# Altium schematic sheet PCB-MAIN_02_MCU.SchDoc
size 594 x 420 mm
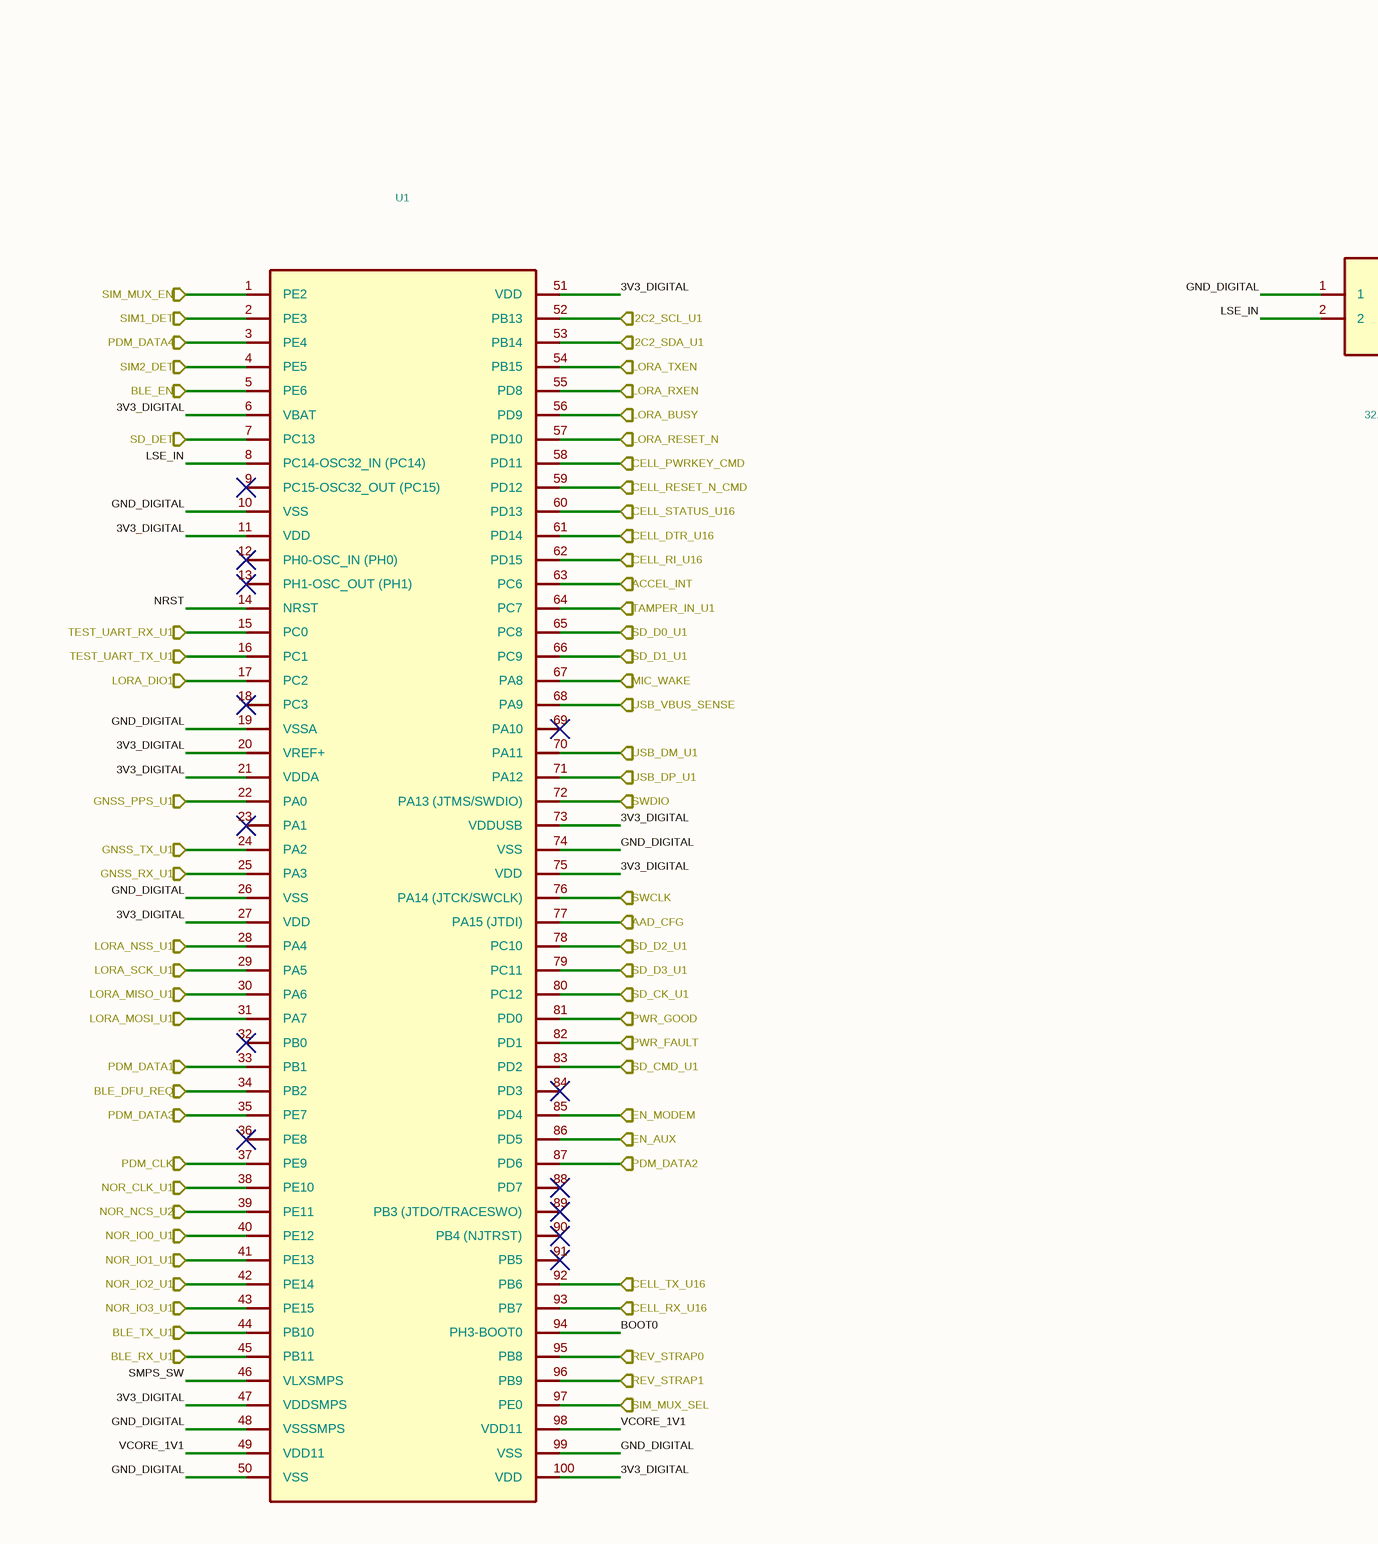
[diagram p0: PCB-MAIN_02_MCU.SchDoc, top left]
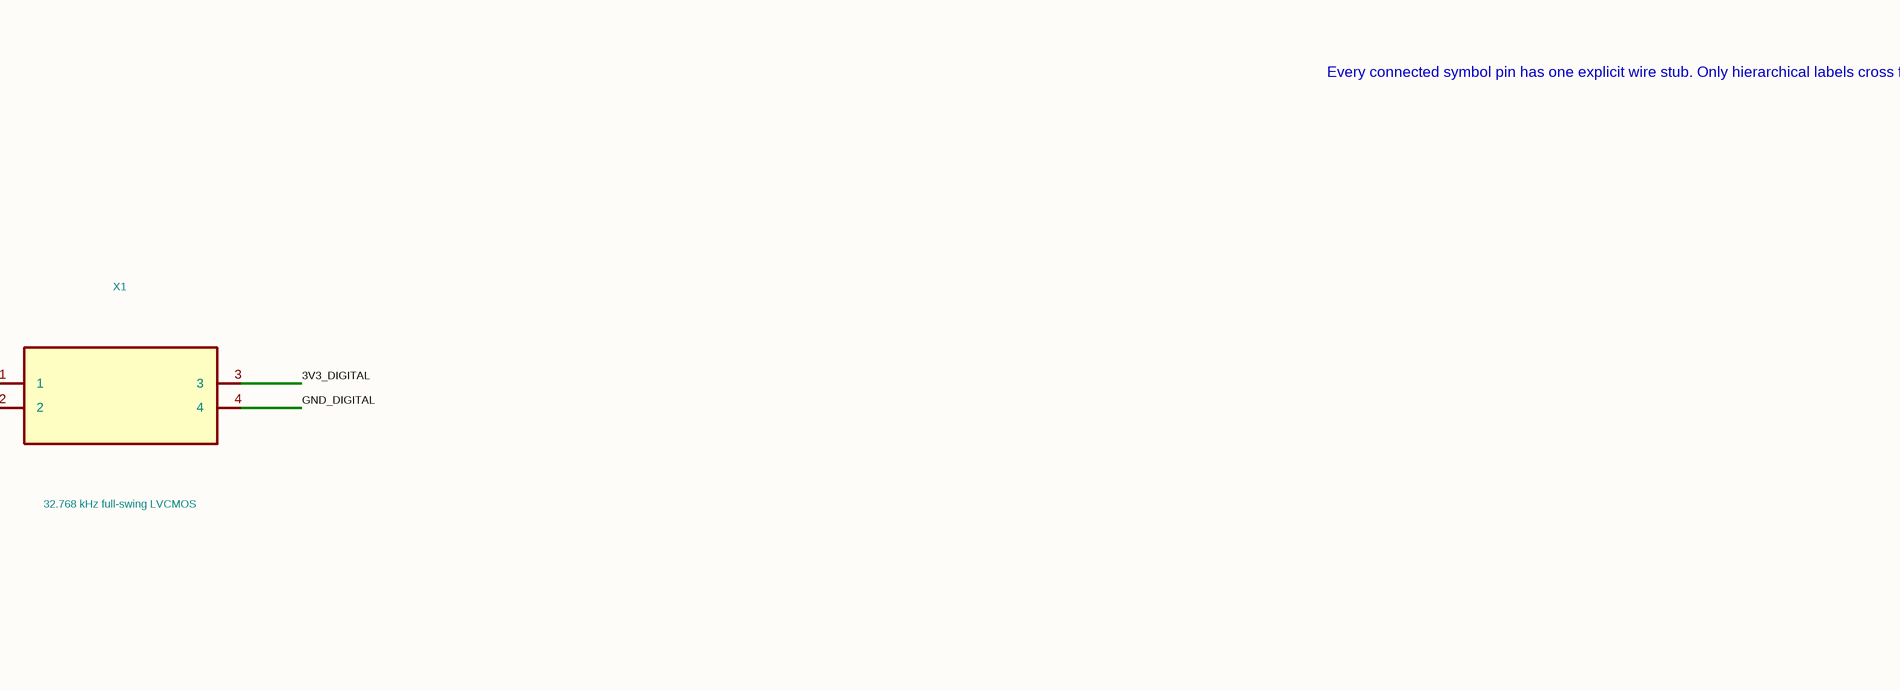
[diagram p1: PCB-MAIN_02_MCU.SchDoc, top middle]
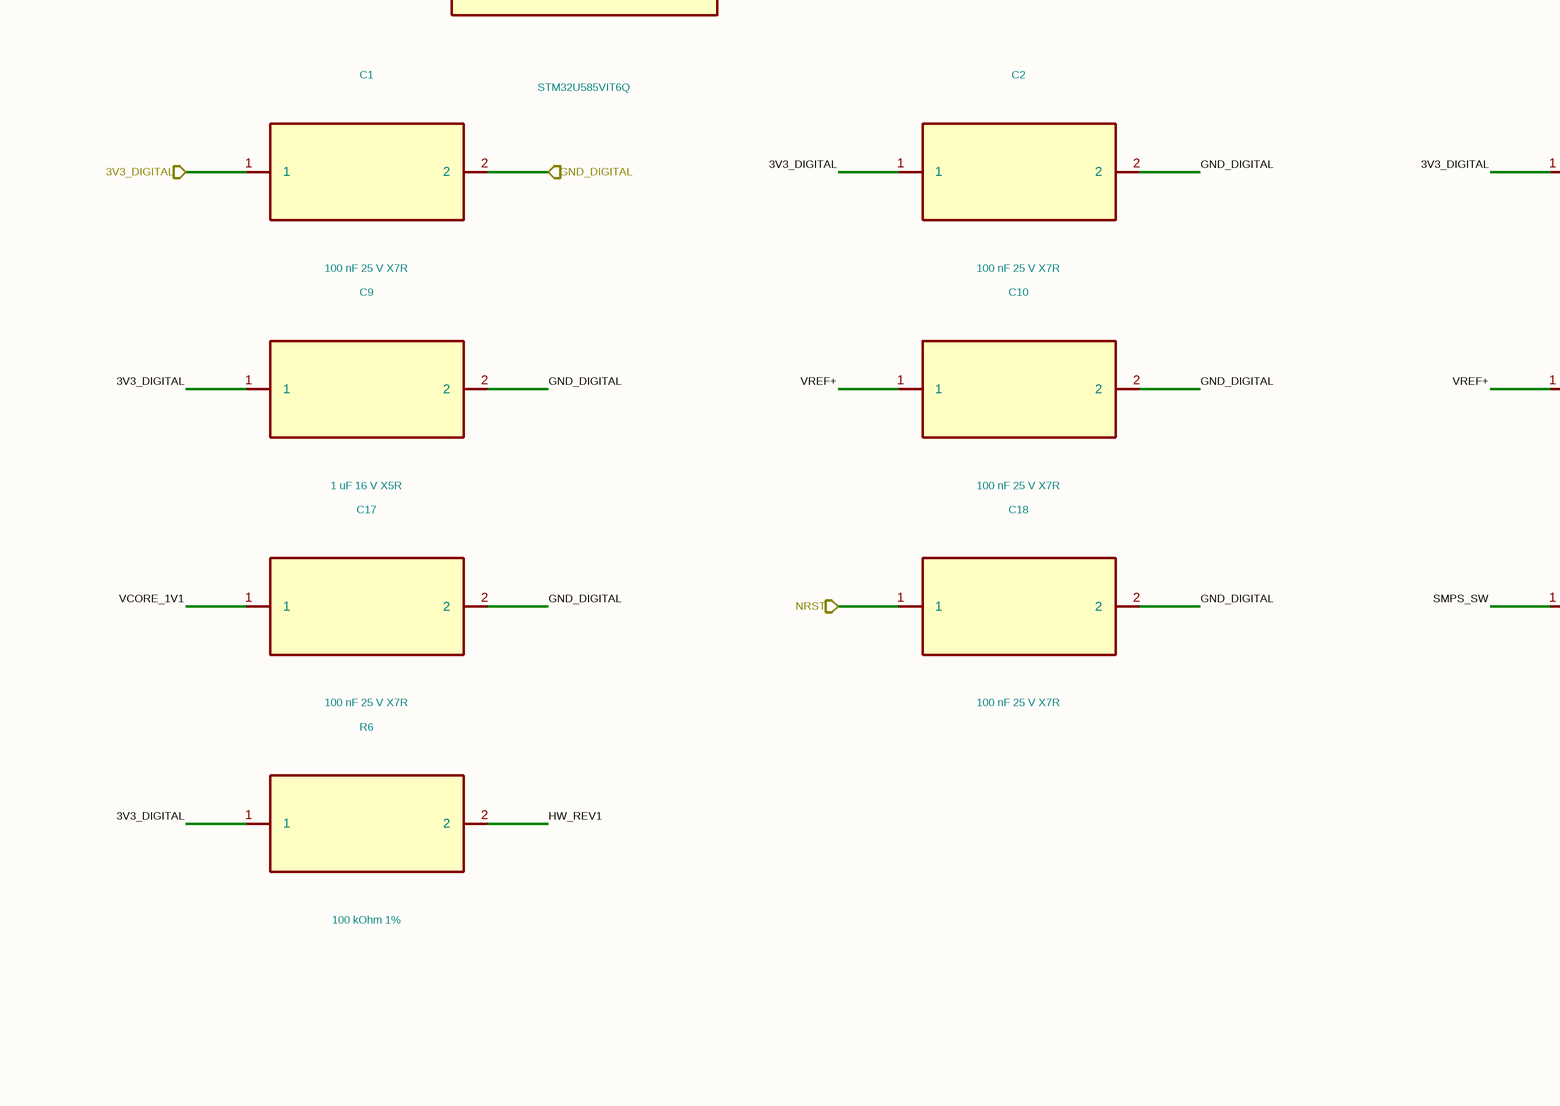
[diagram p2: PCB-MAIN_02_MCU.SchDoc, centre left]
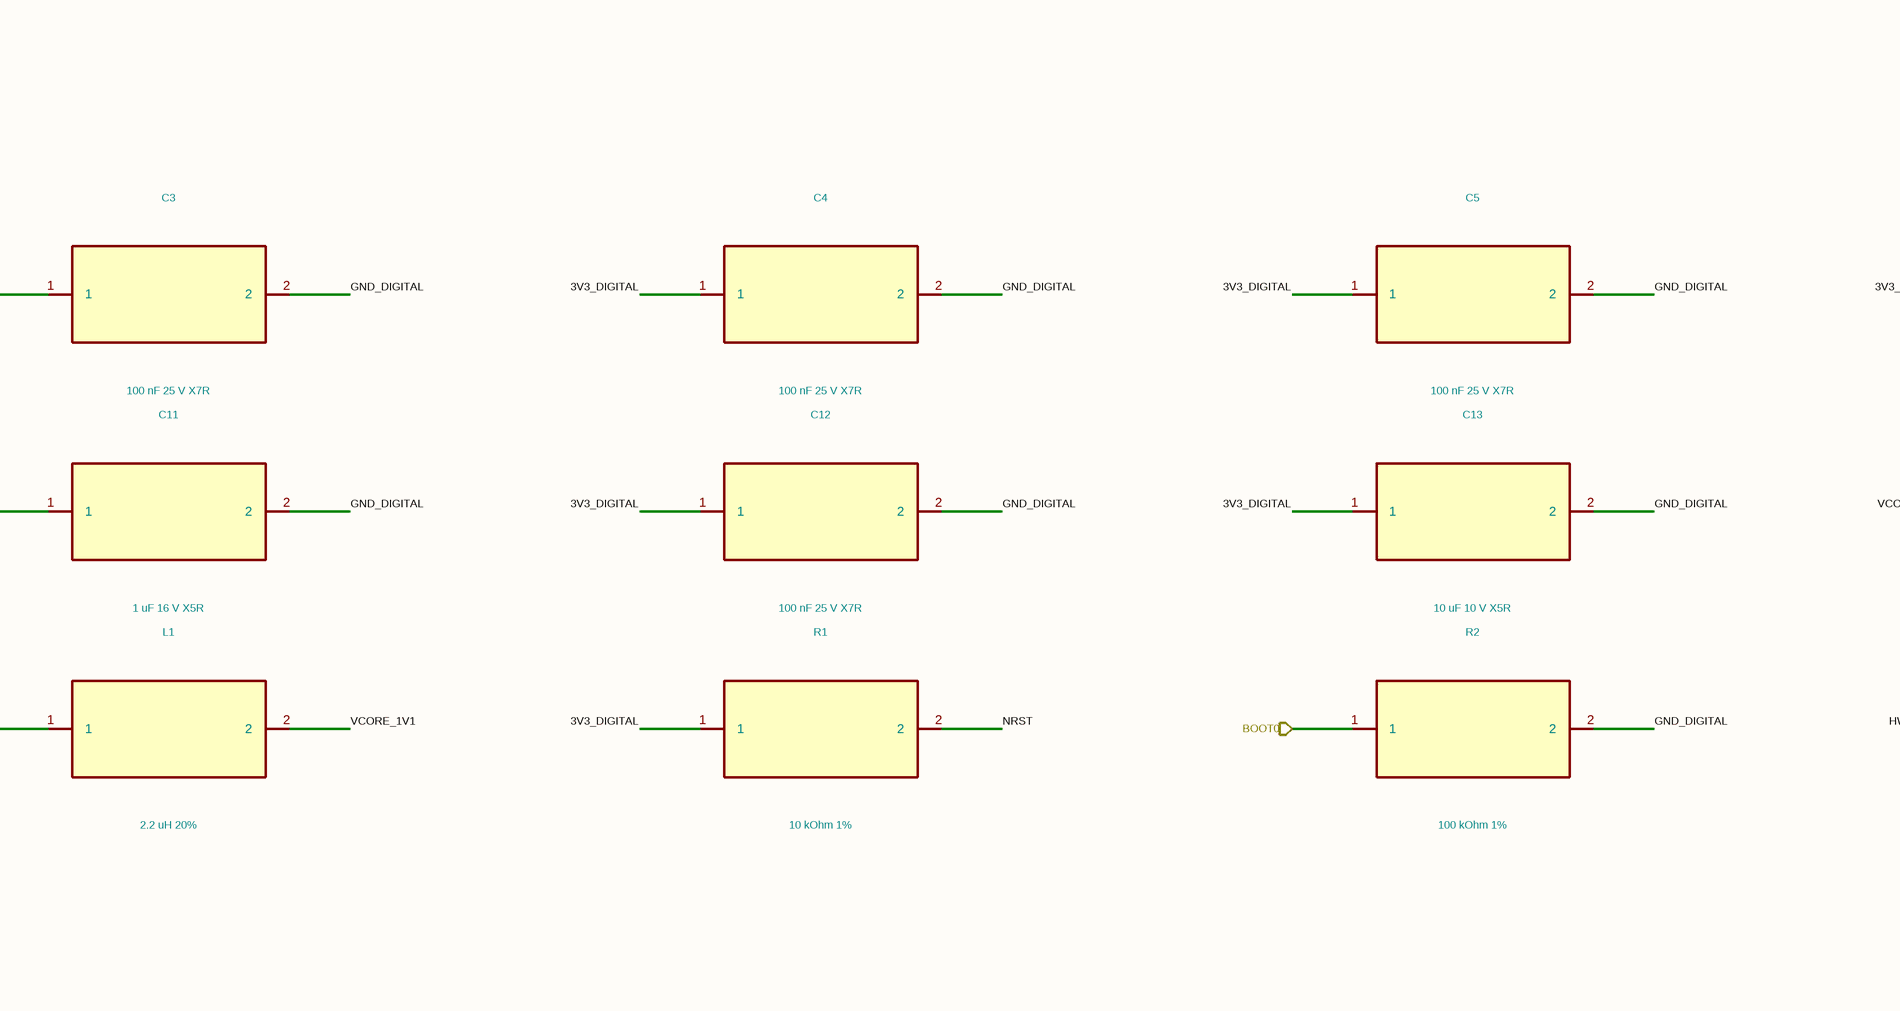
[diagram p3: PCB-MAIN_02_MCU.SchDoc, centre middle]
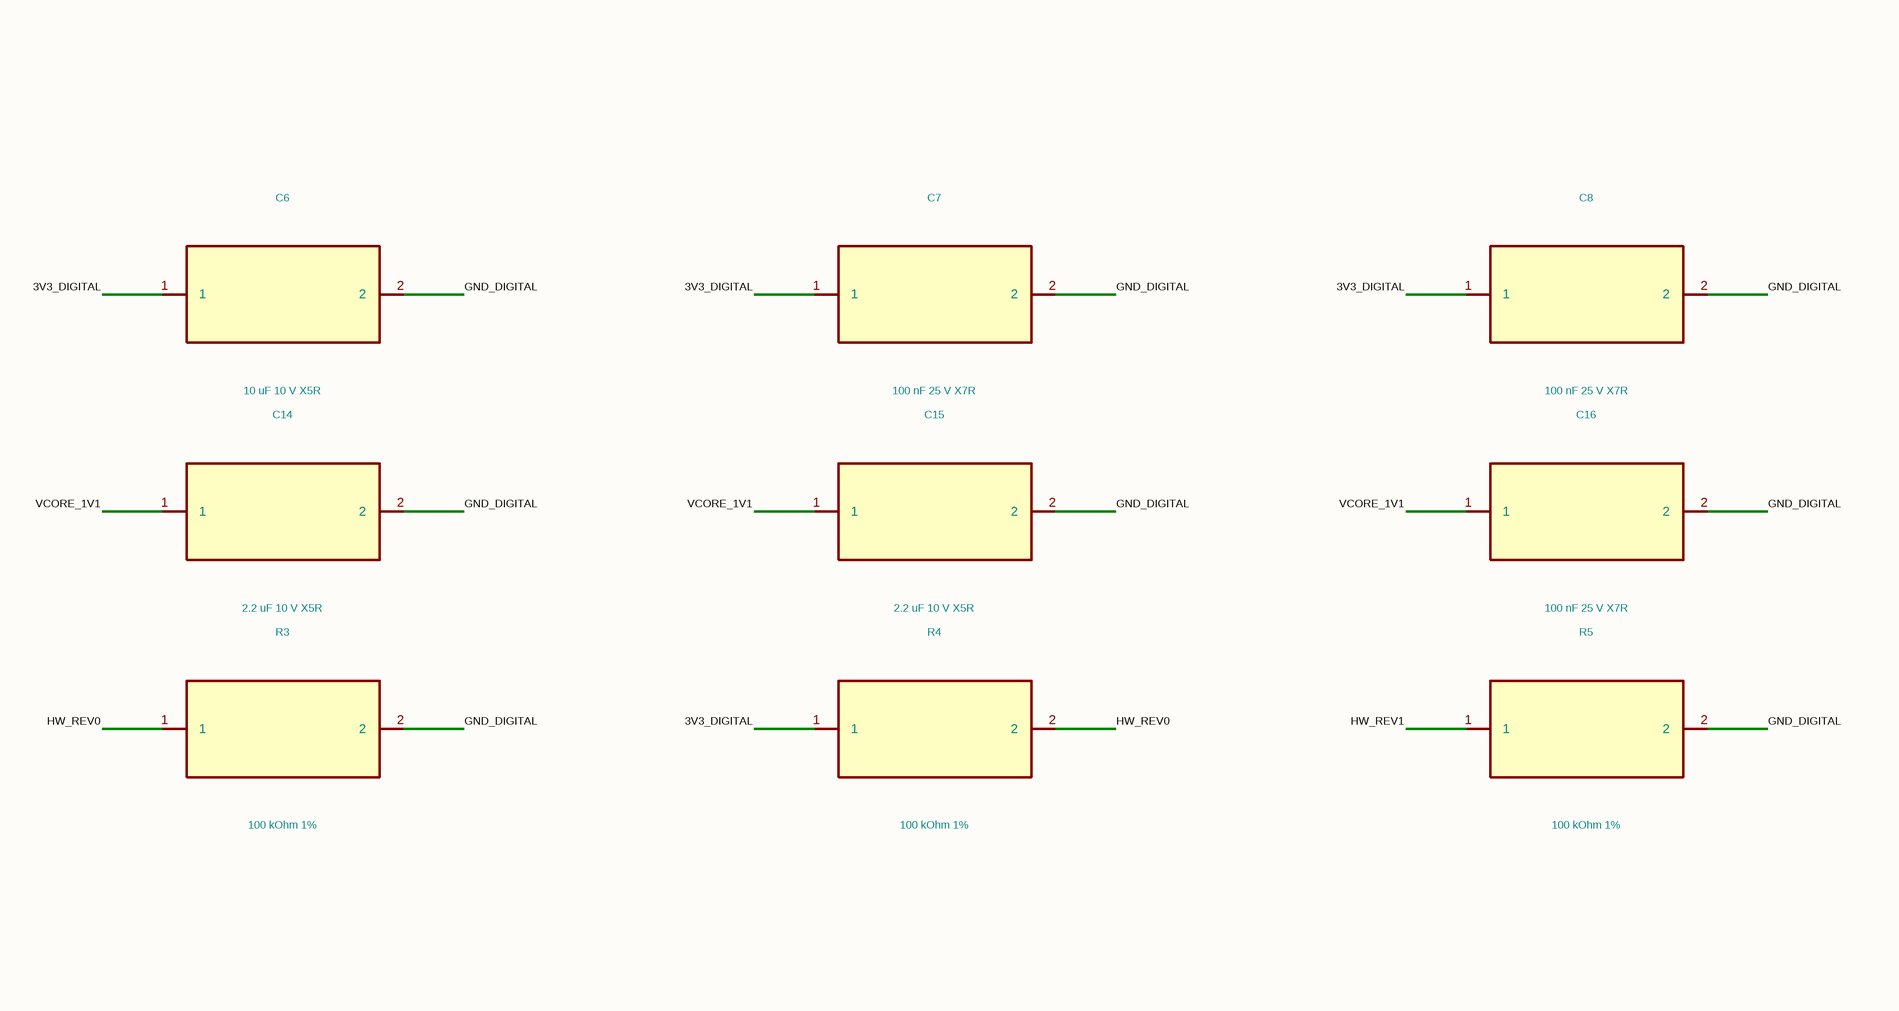
[diagram p4: PCB-MAIN_02_MCU.SchDoc, centre right]
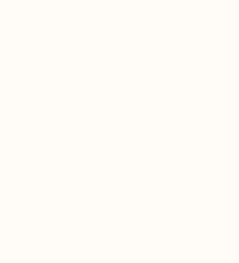
[diagram p5: PCB-MAIN_02_MCU.SchDoc, bottom left]

## Parts
C1  100 nF 25 V X7R  [C_0402_1005Metric]
C2  100 nF 25 V X7R  [C_0402_1005Metric]
C3  100 nF 25 V X7R  [C_0402_1005Metric]
C4  100 nF 25 V X7R  [C_0402_1005Metric]
C5  100 nF 25 V X7R  [C_0402_1005Metric]
C6  10 uF 10 V X5R  [C_0603_1608Metric]
C7  100 nF 25 V X7R  [C_0402_1005Metric]
C8  100 nF 25 V X7R  [C_0402_1005Metric]
C9  1 uF 16 V X5R  [C_0402_1005Metric]
C10  100 nF 25 V X7R  [C_0402_1005Metric]
C11  1 uF 16 V X5R  [C_0402_1005Metric]
C12  100 nF 25 V X7R  [C_0402_1005Metric]
C13  10 uF 10 V X5R  [C_0603_1608Metric]
C14  2.2 uF 10 V X5R  [C_0402_1005Metric]
C15  2.2 uF 10 V X5R  [C_0402_1005Metric]
C16  100 nF 25 V X7R  [C_0402_1005Metric]
C17  100 nF 25 V X7R  [C_0402_1005Metric]
C18  100 nF 25 V X7R  [C_0402_1005Metric]
L1  2.2 uH 20%  [L_1210_3225Metric]
R1  10 kOhm 1%  [R_0402_1005Metric]
R2  100 kOhm 1%  [R_0402_1005Metric]
R3  100 kOhm 1%  [R_0402_1005Metric]
R4  100 kOhm 1%  [R_0402_1005Metric]
R5  100 kOhm 1%  [R_0402_1005Metric]
R6  100 kOhm 1%  [R_0402_1005Metric]
U1  STM32U585VIT6Q
X1  32.768 kHz full-swing LVCMOS

## Ports
3V3_DIGITAL, AAD_CFG, ACCEL_INT, BLE_DFU_REQ, BLE_EN, BLE_RX_U1, BLE_TX_U1, BOOT0, CELL_DTR_U16, CELL_PWRKEY_CMD, CELL_RESET_N_CMD, CELL_RI_U16, CELL_RX_U16, CELL_STATUS_U16, CELL_TX_U16, EN_AUX, EN_MODEM, GND_DIGITAL, GNSS_PPS_U1, GNSS_RX_U1, GNSS_TX_U1, I2C2_SCL_U1, I2C2_SDA_U1, LORA_BUSY, LORA_DIO1, LORA_MISO_U1, LORA_MOSI_U1, LORA_NSS_U1, LORA_RESET_N, LORA_RXEN, LORA_SCK_U1, LORA_TXEN, MIC_WAKE, NOR_CLK_U1, NOR_IO0_U1, NOR_IO1_U1, NOR_IO2_U1, NOR_IO3_U1, NOR_NCS_U2, NRST, PDM_CLK, PDM_DATA1, PDM_DATA2, PDM_DATA3, PDM_DATA4, PWR_FAULT, PWR_GOOD, REV_STRAP0, REV_STRAP1, SD_CK_U1, SD_CMD_U1, SD_D0_U1, SD_D1_U1, SD_D2_U1, SD_D3_U1, SD_DET, SIM1_DET, SIM2_DET, SIM_MUX_EN, SIM_MUX_SEL, SWCLK, SWDIO, TAMPER_IN_U1, TEST_UART_RX_U1, TEST_UART_TX_U1, USB_DM_U1, USB_DP_U1, USB_VBUS_SENSE

## Nets
3V3_DIGITAL: C1.1 ; port 3V3_DIGITAL
3V3_DIGITAL: C2.1 C3.1 C4.1 C5.1 C6.1 C7.1 C8.1 C9.1 C12.1 C13.1 R1.1 R4.1 R6.1 U1.6(VBAT) U1.11(VDD) U1.20(VREF+) U1.21(VDDA) U1.27(VDD) U1.47(VDDSMPS) U1.51(VDD) U1.73(VDDUSB) U1.75(VDD) U1.100(VDD) X1.3  [a separate net that carries the same name]
AAD_CFG: U1.77(PA15_(JTDI)) ; port AAD_CFG
ACCEL_INT: U1.63(PC6) ; port ACCEL_INT
BLE_DFU_REQ: U1.34(PB2) ; port BLE_DFU_REQ
BLE_EN: U1.5(PE6) ; port BLE_EN
BLE_RX_U1: U1.45(PB11) ; port BLE_RX_U1
BLE_TX_U1: U1.44(PB10) ; port BLE_TX_U1
BOOT0: R2.1 ; port BOOT0
BOOT0: U1.94(PH3-BOOT0)  [a separate net that carries the same name]
CELL_DTR_U16: U1.61(PD14) ; port CELL_DTR_U16
CELL_PWRKEY_CMD: U1.58(PD11) ; port CELL_PWRKEY_CMD
CELL_RESET_N_CMD: U1.59(PD12) ; port CELL_RESET_N_CMD
CELL_RI_U16: U1.62(PD15) ; port CELL_RI_U16
CELL_RX_U16: U1.93(PB7) ; port CELL_RX_U16
CELL_STATUS_U16: U1.60(PD13) ; port CELL_STATUS_U16
CELL_TX_U16: U1.92(PB6) ; port CELL_TX_U16
EN_AUX: U1.86(PD5) ; port EN_AUX
EN_MODEM: U1.85(PD4) ; port EN_MODEM
GND_DIGITAL: C1.2 ; port GND_DIGITAL
GND_DIGITAL: C2.2 C3.2 C4.2 C5.2 C6.2 C7.2 C8.2 C9.2 C10.2 C11.2 C12.2 C13.2 C14.2 C15.2 C16.2 C17.2 C18.2 R2.2 R3.2 R5.2 U1.10(VSS) U1.19(VSSA) U1.26(VSS) U1.48(VSSSMPS) U1.50(VSS) U1.74(VSS) U1.99(VSS) X1.1 X1.4  [a separate net that carries the same name]
GNSS_PPS_U1: U1.22(PA0) ; port GNSS_PPS_U1
GNSS_RX_U1: U1.25(PA3) ; port GNSS_RX_U1
GNSS_TX_U1: U1.24(PA2) ; port GNSS_TX_U1
HW_REV0: R3.1 R4.2
HW_REV1: R5.1 R6.2
I2C2_SCL_U1: U1.52(PB13) ; port I2C2_SCL_U1
I2C2_SDA_U1: U1.53(PB14) ; port I2C2_SDA_U1
LORA_BUSY: U1.56(PD9) ; port LORA_BUSY
LORA_DIO1: U1.17(PC2) ; port LORA_DIO1
LORA_MISO_U1: U1.30(PA6) ; port LORA_MISO_U1
LORA_MOSI_U1: U1.31(PA7) ; port LORA_MOSI_U1
LORA_NSS_U1: U1.28(PA4) ; port LORA_NSS_U1
LORA_RESET_N: U1.57(PD10) ; port LORA_RESET_N
LORA_RXEN: U1.55(PD8) ; port LORA_RXEN
LORA_SCK_U1: U1.29(PA5) ; port LORA_SCK_U1
LORA_TXEN: U1.54(PB15) ; port LORA_TXEN
LSE_IN: U1.8(PC14-OSC32_IN_(PC14)) X1.2
MIC_WAKE: U1.67(PA8) ; port MIC_WAKE
NOR_CLK_U1: U1.38(PE10) ; port NOR_CLK_U1
NOR_IO0_U1: U1.40(PE12) ; port NOR_IO0_U1
NOR_IO1_U1: U1.41(PE13) ; port NOR_IO1_U1
NOR_IO2_U1: U1.42(PE14) ; port NOR_IO2_U1
NOR_IO3_U1: U1.43(PE15) ; port NOR_IO3_U1
NOR_NCS_U2: U1.39(PE11) ; port NOR_NCS_U2
NRST: C18.1 ; port NRST
NRST: R1.2 U1.14(NRST)  [a separate net that carries the same name]
PDM_CLK: U1.37(PE9) ; port PDM_CLK
PDM_DATA1: U1.33(PB1) ; port PDM_DATA1
PDM_DATA2: U1.87(PD6) ; port PDM_DATA2
PDM_DATA3: U1.35(PE7) ; port PDM_DATA3
PDM_DATA4: U1.3(PE4) ; port PDM_DATA4
PWR_FAULT: U1.82(PD1) ; port PWR_FAULT
PWR_GOOD: U1.81(PD0) ; port PWR_GOOD
REV_STRAP0: U1.95(PB8) ; port REV_STRAP0
REV_STRAP1: U1.96(PB9) ; port REV_STRAP1
SD_CK_U1: U1.80(PC12) ; port SD_CK_U1
SD_CMD_U1: U1.83(PD2) ; port SD_CMD_U1
SD_D0_U1: U1.65(PC8) ; port SD_D0_U1
SD_D1_U1: U1.66(PC9) ; port SD_D1_U1
SD_D2_U1: U1.78(PC10) ; port SD_D2_U1
SD_D3_U1: U1.79(PC11) ; port SD_D3_U1
SD_DET: U1.7(PC13) ; port SD_DET
SIM1_DET: U1.2(PE3) ; port SIM1_DET
SIM2_DET: U1.4(PE5) ; port SIM2_DET
SIM_MUX_EN: U1.1(PE2) ; port SIM_MUX_EN
SIM_MUX_SEL: U1.97(PE0) ; port SIM_MUX_SEL
SMPS_SW: L1.1 U1.46(VLXSMPS)
SWCLK: U1.76(PA14_(JTCK/SWCLK)) ; port SWCLK
SWDIO: U1.72(PA13_(JTMS/SWDIO)) ; port SWDIO
TAMPER_IN_U1: U1.64(PC7) ; port TAMPER_IN_U1
TEST_UART_RX_U1: U1.15(PC0) ; port TEST_UART_RX_U1
TEST_UART_TX_U1: U1.16(PC1) ; port TEST_UART_TX_U1
USB_DM_U1: U1.70(PA11) ; port USB_DM_U1
USB_DP_U1: U1.71(PA12) ; port USB_DP_U1
USB_VBUS_SENSE: U1.68(PA9) ; port USB_VBUS_SENSE
VCORE_1V1: C14.1 C15.1 C16.1 C17.1 L1.2 U1.49(VDD11) U1.98(VDD11)
VREF+: C10.1 C11.1

Not connected (* = marked no-connect by the designer): U1 9(PC15-OSC32_OUT_(PC15))* 12(PH0-OSC_IN_(PH0))* 13(PH1-OSC_OUT_(PH1))* 18(PC3)* 23(PA1)* 32(PB0)* 36(PE8)* 69(PA10)* 84(PD3)* 88(PD7)* 89(PB3_(JTDO/TRACESWO))* 90(PB4_(NJTRST))* 91(PB5)*

## Notes on the sheet
- Every connected symbol pin has one explicit wire stub. Only hierarchical labels cross functional-sheet boundaries.
- 1
- 2
- 3
- 4
- 5
- 6
- 7
- 8
- 9
- 10
- 11
- A
- B
- C
- D
- E
- F
- G
- H
- Human-readable hierarchy candidate; exact Review-A pin/net equivalence enforced
- Functional sheet 3 of 10
- NOT FOR MANUFACTURE - hierarchy review/routing/DRC/DFM/Review B pending
- Title: Dioneya PCB-MAIN Rev.A - MCU
- File: PCB-MAIN_02_MCU.kicad_sch
- Sheet: /
- Dioneya / ZS-BPLA
- KiCad E.D.A.  kicad (5.1.4)-1
- Size: A2
- Date: 2026-09-16
- Rev: A
- Id: 1/1

## Library data of the parts
C1 = C1_GRM155R71E104KE14D: Manufacturer: Murata; Population: FITTED; Authority: ST_AN5373_Rev7; MPN: GRM155R71E104KE14D; Package: 0402; Value: 100 nF 25 V X7R; Footprint: Capacitor_SMD:C_0402_1005Metric
C2 = C2_GRM155R71E104KE14D: Manufacturer: Murata; Population: FITTED; Authority: ST_AN5373_Rev7; MPN: GRM155R71E104KE14D; Package: 0402; Value: 100 nF 25 V X7R; Footprint: Capacitor_SMD:C_0402_1005Metric
C3 = C3_GRM155R71E104KE14D: Manufacturer: Murata; Population: FITTED; Authority: ST_AN5373_Rev7; MPN: GRM155R71E104KE14D; Package: 0402; Value: 100 nF 25 V X7R; Footprint: Capacitor_SMD:C_0402_1005Metric
C4 = C4_GRM155R71E104KE14D: Manufacturer: Murata; Population: FITTED; Authority: ST_AN5373_Rev7; MPN: GRM155R71E104KE14D; Package: 0402; Value: 100 nF 25 V X7R; Footprint: Capacitor_SMD:C_0402_1005Metric
C5 = C5_GRM155R71E104KE14D: Manufacturer: Murata; Population: FITTED; Authority: ST_AN5373_Rev7; MPN: GRM155R71E104KE14D; Package: 0402; Value: 100 nF 25 V X7R; Footprint: Capacitor_SMD:C_0402_1005Metric
C6 = C6_GRM188R61A106KE69D: Manufacturer: Murata; Population: FITTED; Authority: ST_AN5373_Rev7; MPN: GRM188R61A106KE69D; Package: 0603; Value: 10 uF 10 V X5R; Footprint: Capacitor_SMD:C_0603_1608Metric
C7 = C7_GRM155R71E104KE14D: Manufacturer: Murata; Population: FITTED; Authority: ST_AN5373_Rev7; MPN: GRM155R71E104KE14D; Package: 0402; Value: 100 nF 25 V X7R; Footprint: Capacitor_SMD:C_0402_1005Metric
C8 = C8_GRM155R71E104KE14D: Manufacturer: Murata; Population: FITTED; Authority: ST_AN5373_Rev7; MPN: GRM155R71E104KE14D; Package: 0402; Value: 100 nF 25 V X7R; Footprint: Capacitor_SMD:C_0402_1005Metric
C9 = C9_GRM155R61C105KA12D: Manufacturer: Murata; Population: FITTED; Authority: ST_AN5373_Rev7; MPN: GRM155R61C105KA12D; Package: 0402; Value: 1 uF 16 V X5R; Footprint: Capacitor_SMD:C_0402_1005Metric
C10 = C10_GRM155R71E104KE14D: Manufacturer: Murata; Population: FITTED; Authority: ST_AN5373_Rev7; MPN: GRM155R71E104KE14D; Package: 0402; Value: 100 nF 25 V X7R; Footprint: Capacitor_SMD:C_0402_1005Metric
C11 = C11_GRM155R61C105KA12D: Manufacturer: Murata; Population: FITTED; Authority: ST_AN5373_Rev7; MPN: GRM155R61C105KA12D; Package: 0402; Value: 1 uF 16 V X5R; Footprint: Capacitor_SMD:C_0402_1005Metric
C12 = C12_GRM155R71E104KE14D: Manufacturer: Murata; Population: FITTED; Authority: ST_AN5373_Rev7; MPN: GRM155R71E104KE14D; Package: 0402; Value: 100 nF 25 V X7R; Footprint: Capacitor_SMD:C_0402_1005Metric
C13 = C13_GRM188R61A106KE69D: Manufacturer: Murata; Population: FITTED; Authority: ST_AN5373_Rev7; MPN: GRM188R61A106KE69D; Package: 0603; Value: 10 uF 10 V X5R; Footprint: Capacitor_SMD:C_0603_1608Metric
C14 = C14_GRM155R61A225KE15D: Manufacturer: Murata; Population: FITTED; Authority: ST_AN5373_Rev7; MPN: GRM155R61A225KE15D; Package: 0402; Value: 2.2 uF 10 V X5R; Footprint: Capacitor_SMD:C_0402_1005Metric
C15 = C15_GRM155R61A225KE15D: Manufacturer: Murata; Population: FITTED; Authority: ST_AN5373_Rev7; MPN: GRM155R61A225KE15D; Package: 0402; Value: 2.2 uF 10 V X5R; Footprint: Capacitor_SMD:C_0402_1005Metric
C16 = C16_GRM155R71E104KE14D: Manufacturer: Murata; Population: DNP; Authority: ST_AN5373_Rev7; MPN: GRM155R71E104KE14D; Package: 0402; Value: 100 nF 25 V X7R; Footprint: Capacitor_SMD:C_0402_1005Metric
C17 = C17_GRM155R71E104KE14D: Manufacturer: Murata; Population: DNP; Authority: ST_AN5373_Rev7; MPN: GRM155R71E104KE14D; Package: 0402; Value: 100 nF 25 V X7R; Footprint: Capacitor_SMD:C_0402_1005Metric
C18 = C18_GRM155R71E104KE14D: Manufacturer: Murata; Population: FITTED; Authority: ST_AN5373_Rev7; MPN: GRM155R71E104KE14D; Package: 0402; Value: 100 nF 25 V X7R; Footprint: Capacitor_SMD:C_0402_1005Metric
L1 = L1_LQH32PN2R2NN0L: Manufacturer: Murata; Population: FITTED; Authority: ST_AN5373_Rev7; MPN: LQH32PN2R2NN0L; Package: 1210; Value: 2.2 uH 20%; Footprint: Inductor_SMD:L_1210_3225Metric
R1 = R1_ERJ-2RKF1002X: Manufacturer: Panasonic; Population: FITTED; Authority: ST_AN5373_Rev7; MPN: ERJ-2RKF1002X; Package: 0402; Value: 10 kOhm 1%; Footprint: Resistor_SMD:R_0402_1005Metric
R2 = R2_ERJ-2RKF1003X: Manufacturer: Panasonic; Population: FITTED; Authority: ST_AN2606; MPN: ERJ-2RKF1003X; Package: 0402; Value: 100 kOhm 1%; Footprint: Resistor_SMD:R_0402_1005Metric
R3 = R3_ERJ-2RKF1003X: Manufacturer: Panasonic; Population: FITTED; Authority: PROJECT_MAIN_AUTH_010; MPN: ERJ-2RKF1003X; Package: 0402; Value: 100 kOhm 1%; Footprint: Resistor_SMD:R_0402_1005Metric
R4 = R4_ERJ-2RKF1003X: Manufacturer: Panasonic; Population: DNP; Authority: PROJECT_MAIN_AUTH_010; MPN: ERJ-2RKF1003X; Package: 0402; Value: 100 kOhm 1%; Footprint: Resistor_SMD:R_0402_1005Metric
R5 = R5_ERJ-2RKF1003X: Manufacturer: Panasonic; Population: FITTED; Authority: PROJECT_MAIN_AUTH_010; MPN: ERJ-2RKF1003X; Package: 0402; Value: 100 kOhm 1%; Footprint: Resistor_SMD:R_0402_1005Metric
R6 = R6_ERJ-2RKF1003X: Manufacturer: Panasonic; Population: DNP; Authority: PROJECT_MAIN_AUTH_010; MPN: ERJ-2RKF1003X; Package: 0402; Value: 100 kOhm 1%; Footprint: Resistor_SMD:R_0402_1005Metric
U1 = U1_STM32U585VIT6Q: Manufacturer: STMicroelectronics; Population: FITTED; Authority: PCB_MAIN_MCU_PIN_AUTHORITY_REV_A.csv; MPN: STM32U585VIT6Q; Package: LQFP100_14x14; Value: STM32U585VIT6Q
X1 = X1_SiT1552AI-JE-DCC-32.768D: Manufacturer: SiTime; Population: FITTED; Authority: SiTime_SiT1552_Rev1.43; MPN: SiT1552AI-JE-DCC-32.768D; Package: CSP-4_1.5x0.8mm; Value: 32.768 kHz full-swing LVCMOS